# Altium schematic sheet 4.Communication Interface.SchDoc
size A4; Author: DaiJun; Revision: 1.0; SheetNumber: 4; SheetTotal: 4; Size: A3; Contact: 0731-88731029
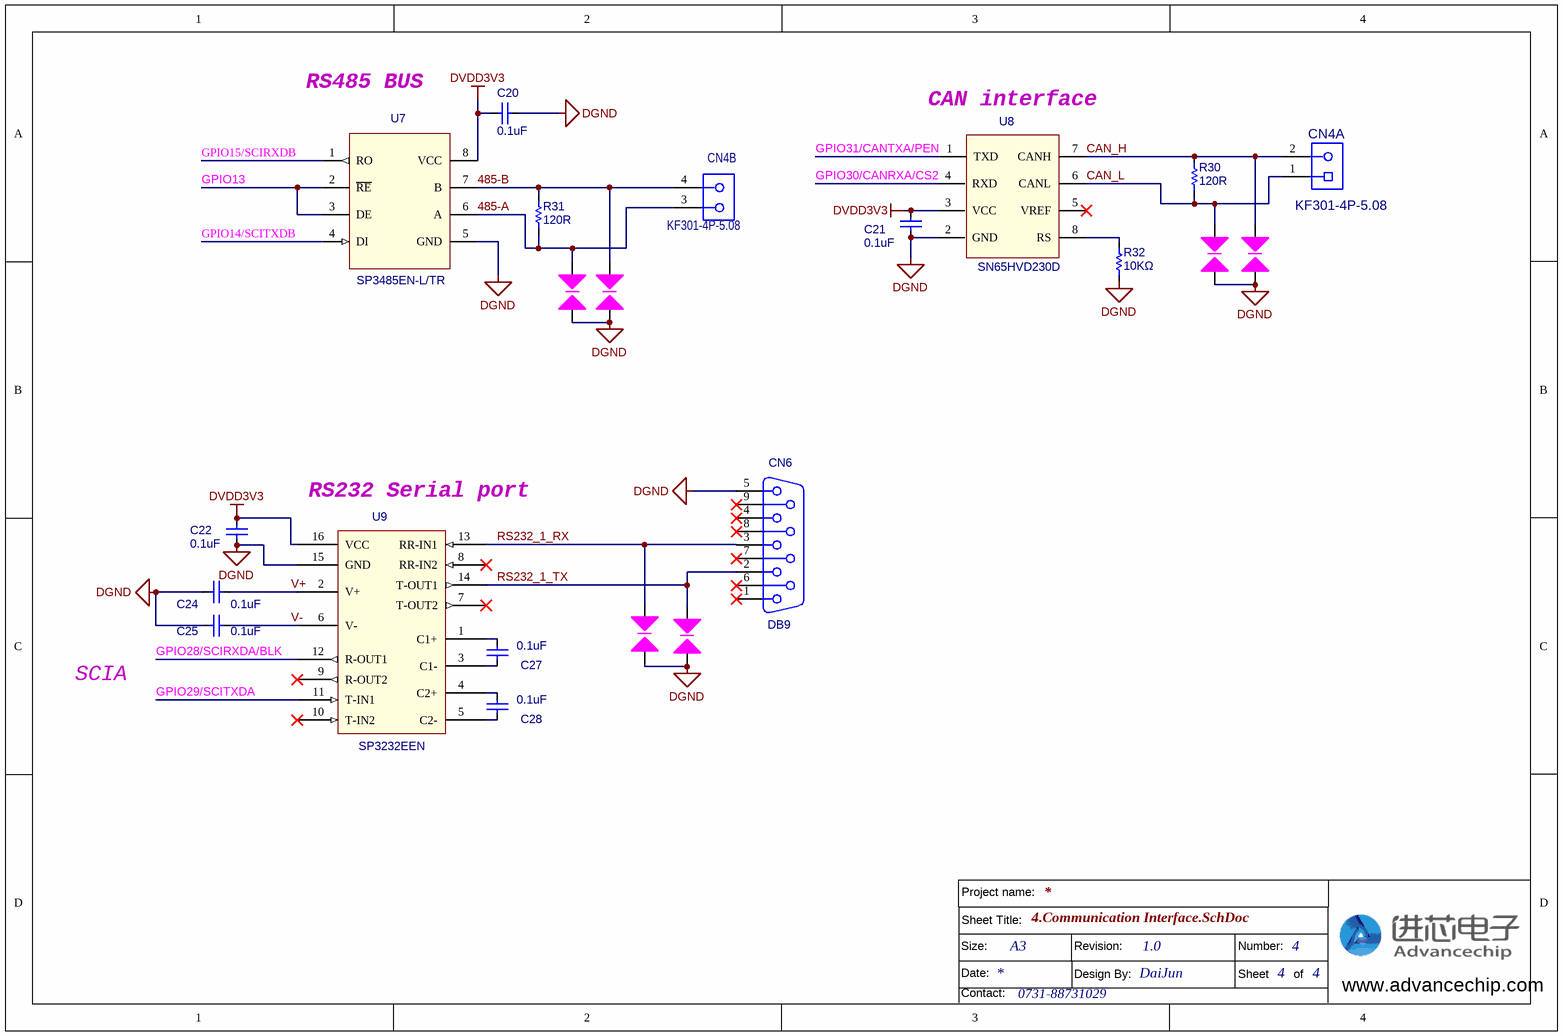
[diagram p0: 4.Communication Interface.SchDoc]

## Parts
C20  value 0.1uF  [C0603]  (hidden comment: 0.1uF/50V)
C21  value 0.1uF  [C0603]  (hidden comment: 0.1uF/50V)
C22  value 0.1uF  [C0603]  (hidden comment: 0.1uF/50V)
C24  value 0.1uF  [C0603]  (hidden comment: 0.1uF/50V)
C25  value 0.1uF  [C0603]  (hidden comment: 0.1uF/50V)
C27  value 0.1uF  [C0603]  (hidden comment: 0.1uF/50V)
C28  value 0.1uF  [C0603]  (hidden comment: 0.1uF/50V)
CN4  KF301-4P-5.08  [J-DG128-4]  (parts A,B of 2)
CN6  DB9  [db9]
R30  120R  [1206RX]
R31  120R  [1206RX]
R32  10KΩ  [R0603]
T1  SPARK_GAP  [SPARK_GAP]  (value not drawn)
T2  SPARK_GAP  [SPARK_GAP]  (value not drawn)
T3  SPARK_GAP  [SPARK_GAP]  (value not drawn)
T4  SPARK_GAP  [SPARK_GAP]  (value not drawn)
T5  SPARK_GAP  [SPARK_GAP]  (value not drawn)
T6  SPARK_GAP  [SPARK_GAP]  (value not drawn)
U7  SP3485EN-L/TR  [SO-8]
U8  SN65HVD230D  [SO-8]
U9  SP3232EEN  [SOIC-16_150mil]

## Nets
DGND: C20.2 C21.2 C22.2 C24.2 C25.2 CN6.5 R32.1 T1.2(A) T2.2(A) T3.2(A) T4.2(A) T5.2(A) T6.2(A) U7.5(GND) U8.2(GND) U9.15(GND)
DVDD3V3: C20.1 C21.1 C22.1 U7.8(VCC) U8.3(VCC) U9.16(VCC)
485-A: CN4.3 R31.1 T3.1(A) U7.6(A)
485-B: CN4.4 R31.2 T4.1(A) U7.7(B)
CAN_H: CN4.2 R30.2 T2.1(A) U8.7(CANH)
CAN_L: CN4.1 R30.1 T1.1(A) U8.6(CANL)
GPIO13: U7.2(~{RE}) U7.3(DE)
GPIO14/SCITXDB: U7.4(DI)
GPIO15/SCIRXDB: U7.1(RO)
GPIO28/SCIRXDA/BLK: U9.12(R-OUT1)
GPIO29/SCITXDA: U9.11(T-IN1)
GPIO30/CANRXA/CS2: U8.4(RXD)
GPIO31/CANTXA/PEN: U8.1(TXD)
RS232_1_RX: CN6.3 T5.1(A) U9.13(RR-IN1)
RS232_1_TX: CN6.2 T6.1(A) U9.14(T-OUT1)
V+: C24.1 U9.2(V+)
V-: C25.1 U9.6(V-)
NetC27_1: C27.1 U9.1(C1+)
NetC27_2: C27.2 U9.3(C1-)
NetC28_1: C28.1 U9.4(C2+)
NetC28_2: C28.2 U9.5(C2-)
NetR32_2: R32.2 U8.8(RS)

Not connected (* = marked no-connect by the designer): CN6 1* 4* 6* 7* 8* 9*; U8 5(VREF)*; U9 7(T-OUT2)* 8(RR-IN2)* 9(R-OUT2)* 10(T-IN2)*

## Notes on the sheet
- RS485 BUS
- (near U8) CAN interface
- (near U9) RS232 Serial port
- SCIA
- Sheet Title:
- Project name:
- Size:
- Date:
- Contact:
- Revision:
- Design By:
- Number:
- Sheet       of
- www.advancechip.com

## Library data of the parts
C20-C22 C24 C25 C27 C28 = Cap: 贴片电容; Published: 8-Jun-2000; LatestRevisionDate: 17-Jul-2002; LatestRevisionNote: Re-released for DXP Platform.; Publisher: Altium Limited
CN4 = CON4: 连接器
CN6 = D Connector 9: DB9插座; PackageDocument: O; Positions: 9; Gender: Receptacle; Published: 15-Jun-2001; LatestRevisionDate: 17-Jul-2002; LatestRevisionNote: Re-released for DXP Platform.; DatasheetDocument: 1-Sep-1999; PackageReference: 788750; Publisher: Altium Limited; Orientation: Right Angle
R30 = Res: 贴片电阻; Published: 8-Jun-2000; LatestRevisionDate: 17-Jul-2002; LatestRevisionNote: Re-released for DXP Platform.; Publisher: Altium Limited
R31 R32 = Res: 贴片电阻; Value: 1K; Published: 8-Jun-2000; LatestRevisionDate: 17-Jul-2002; LatestRevisionNote: Re-released for DXP Platform.; Publisher: Altium Limited
T1-T6 = GND SIDE: 静电GAP
U7 = SP3485E: 3.3V 485总线收发器
U8 = SN65HVD230D: 3.3V CAN通讯
U9 = MAX232: 低压232通讯芯片